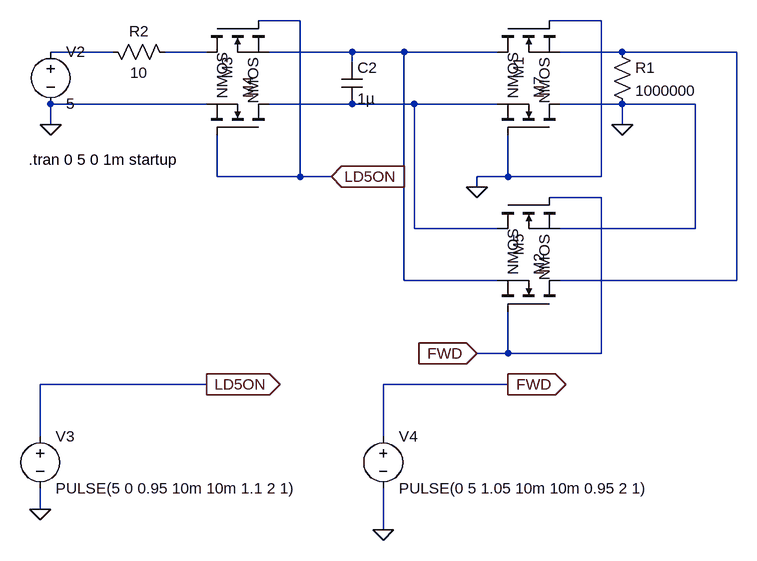
[diagram p0: schematic Driver5.asc]
Driver5.asc, the LTspice schematic file:
Version 4
SHEET 1 2516 1212
WIRE 48 272 -16 272
WIRE 512 272 432 272
WIRE -240 320 -336 320
WIRE -96 320 -160 320
WIRE 128 320 0 320
WIRE 208 320 128 320
WIRE 352 320 208 320
WIRE 544 320 448 320
WIRE 720 320 544 320
WIRE 128 336 128 320
WIRE -96 400 -336 400
WIRE 128 400 0 400
WIRE 224 400 128 400
WIRE 352 400 224 400
WIRE 544 400 448 400
WIRE 656 400 544 400
WIRE -336 432 -336 400
WIRE 544 432 544 400
WIRE -80 512 -80 448
WIRE 48 512 48 272
WIRE 48 512 -80 512
WIRE 96 512 48 512
WIRE 368 512 368 448
WIRE 368 512 320 512
WIRE 512 512 512 272
WIRE 512 512 368 512
WIRE 320 528 320 512
WIRE 512 544 432 544
WIRE 224 592 224 400
WIRE 352 592 224 592
WIRE 656 592 656 400
WIRE 656 592 448 592
WIRE 208 672 208 320
WIRE 352 672 208 672
WIRE 720 672 720 320
WIRE 720 672 448 672
WIRE 368 784 368 720
WIRE 368 784 320 784
WIRE 512 784 512 544
WIRE 512 784 368 784
WIRE -96 832 -352 832
WIRE 368 832 176 832
WIRE -352 912 -352 832
WIRE 176 912 176 832
WIRE -352 1024 -352 992
WIRE 176 1056 176 992
FLAG 96 512 LD5ON
IOPIN 96 512 In
FLAG -96 832 LD5ON
IOPIN -96 832 Out
FLAG 368 832 FWD
IOPIN 368 832 Out
FLAG 176 1056 0
FLAG -352 1024 0
FLAG -336 432 0
FLAG 544 432 0
FLAG 320 784 FWD
IOPIN 320 784 In
FLAG 320 528 0
SYMBOL cap 112 336 R0
SYMATTR InstName C2
SYMATTR Value 1µ
SYMATTR SpiceLine V=4 Irms=1.62 Rser=0.0464862 Lser=0
SYMBOL voltage -336 304 R0
WINDOW 123 0 0 Left 0
WINDOW 39 0 0 Left 0
SYMATTR InstName V2
SYMATTR Value 5
SYMBOL res -256 304 M90
WINDOW 0 0 56 VBottom 2
WINDOW 3 32 56 VTop 2
SYMATTR InstName R2
SYMATTR Value 10
SYMBOL nmos -96 272 M90
SYMATTR InstName M3
SYMBOL nmos 0 448 M270
SYMATTR InstName M4
SYMBOL nmos 448 448 M270
SYMATTR InstName M7
SYMBOL voltage -352 896 R0
WINDOW 123 0 0 Left 0
WINDOW 39 0 0 Left 0
SYMATTR InstName V3
SYMATTR Value PULSE(5 0 0.95 10m 10m 1.1 2 1)
SYMBOL voltage 176 896 R0
WINDOW 123 0 0 Left 0
WINDOW 39 0 0 Left 0
SYMATTR InstName V4
SYMATTR Value PULSE(0 5 1.05 10m 10m 0.95 2 1)
SYMBOL nmos 352 272 M90
SYMATTR InstName M1
SYMBOL res 528 304 R0
SYMATTR InstName R1
SYMATTR Value 1000000
SYMBOL nmos 448 720 M270
SYMATTR InstName M2
SYMBOL nmos 352 544 M90
SYMATTR InstName M5
TEXT -370 486 Left 2 !.tran 0 5 0 1m startup

The netlist it stands for:
* Driver5.asc
C2 N003 N005 1µ V=4 Irms=1.62 Rser=0.0464862 Lser=0
V2 N001 0 5
R2 N001 N002 10
M3 N002 LD5ON N003 N003 NMOS
M4 N005 LD5ON 0 0 NMOS
M7 0 0 N005 N005 NMOS
V3 LD5ON 0 PULSE(5 0 0.95 10m 10m 1.1 2 1)
V4 FWD 0 PULSE(0 5 1.05 10m 10m 0.95 2 1)
M1 N003 0 N004 N004 NMOS
R1 N004 0 1000000
M2 N004 FWD N003 N003 NMOS
M5 N005 FWD 0 0 NMOS
.model NMOS NMOS
.model PMOS PMOS
.lib standard.mos
.tran 0 5 0 1m startup
.backanno
.end